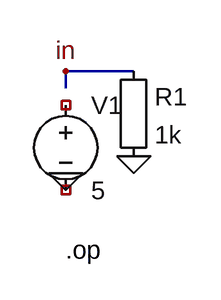
[diagram p0: schematic Simbolo - EuropeanResistor.asc]
Simbolo - EuropeanResistor.asc, the LTspice schematic file:
Version 4
SHEET 1 880 680
WIRE 128 112 64 112
WIRE 64 112 64 128
FLAG 128 192 0
FLAG 64 208 0
FLAG 64 112 in
SYMBOL Misc\EuropeanResistor 112 96 R0
SYMATTR InstName R1
SYMATTR Value 1k
SYMBOL voltage 64 128 R0
SYMATTR InstName V1
SYMATTR Value 5
TEXT 64 280 Left 2 !.op

The netlist it stands for:
* Simbolo - EuropeanResistor.asc
R1 in 0 1k
V1 NC_01 NC_02 5
.op
.backanno
.end